# Altium schematic sheet Power-Section.SchDoc
size A4; SheetNumber: 2
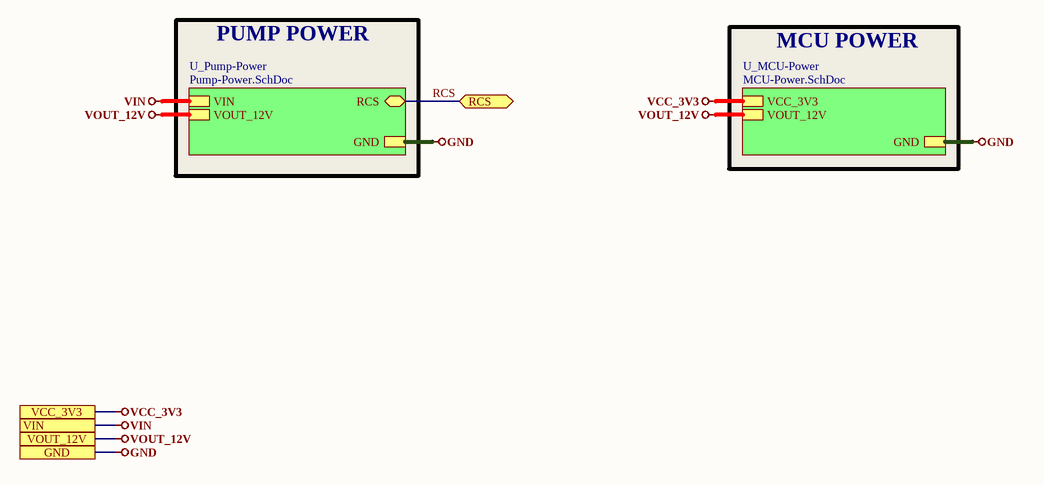
[diagram p0: Power-Section.SchDoc]

## Sub-sheets
U_MCU-Power = MCU-Power.SchDoc: VCC_3V3, GND, VOUT_12V
U_Pump-Power = Pump-Power.SchDoc: RCS (bidir), VOUT_12V, VIN, GND

## Ports
GND, RCS (bidir), VCC_3V3, VIN, VOUT_12V

## Nets
GND: port GND, sheet U_Pump-Power/GND, sheet U_MCU-Power/GND
VCC_3V3: port VCC_3V3, sheet U_MCU-Power/VCC_3V3
VIN: port VIN, sheet U_Pump-Power/VIN
VOUT_12V: port VOUT_12V, sheet U_Pump-Power/VOUT_12V, sheet U_MCU-Power/VOUT_12V
RCS: port RCS, sheet U_Pump-Power/RCS

## Notes on the sheet
- PUMP POWER
- MCU POWER